# Altium schematic sheet [04] - MECANICO.SchDoc
size A4; DocumentNumber: 5; SheetNumber: 5; SheetTotal: 6
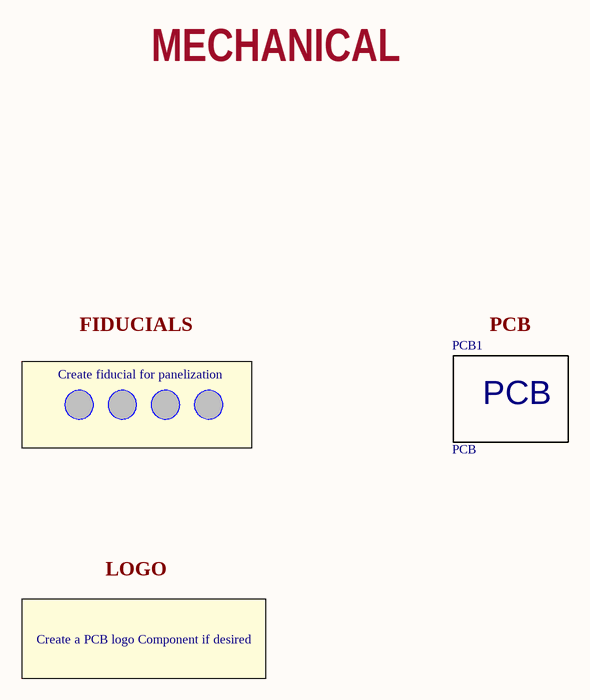
[diagram p0: [04] - MECANICO.SchDoc]

## Parts
FID1  FIDUCIAL  [FIDUCIAL - 1.27mm]  (value not drawn)  (no BOM)
FID2  FIDUCIAL  [FIDUCIAL - 1.27mm]  (value not drawn)  (no BOM)
FID3  FIDUCIAL  [FIDUCIAL - 1.27mm]  (value not drawn)  (no BOM)
FID4  FIDUCIAL  [FIDUCIAL - 1.27mm]  (value not drawn)  (no BOM)
PCB1  PCB

## Blocks framed on the sheet
Create fiducial for panelization: FID1-FID4

## Notes on the sheet
- MECHANICAL
- FIDUCIALS
- PCB
- LOGO
- Create a PCB logo Component if desired
- Project:
- Revision:
- Engineer:
- Title:
- Page
- of
- Embedded Things
- Date:
- Hour:
- Variant:

## Library data of the parts
FID1-FID4 = FIDUCIAL: Pad size: 1.27mm; Value: FIDUCIAL
PCB1 = PCB: Category: Printed Circuit Board